# Altium schematic sheet Ethernet_PHY_2.SchDoc
size A4; SheetNumber: 6; SheetTotal: 16
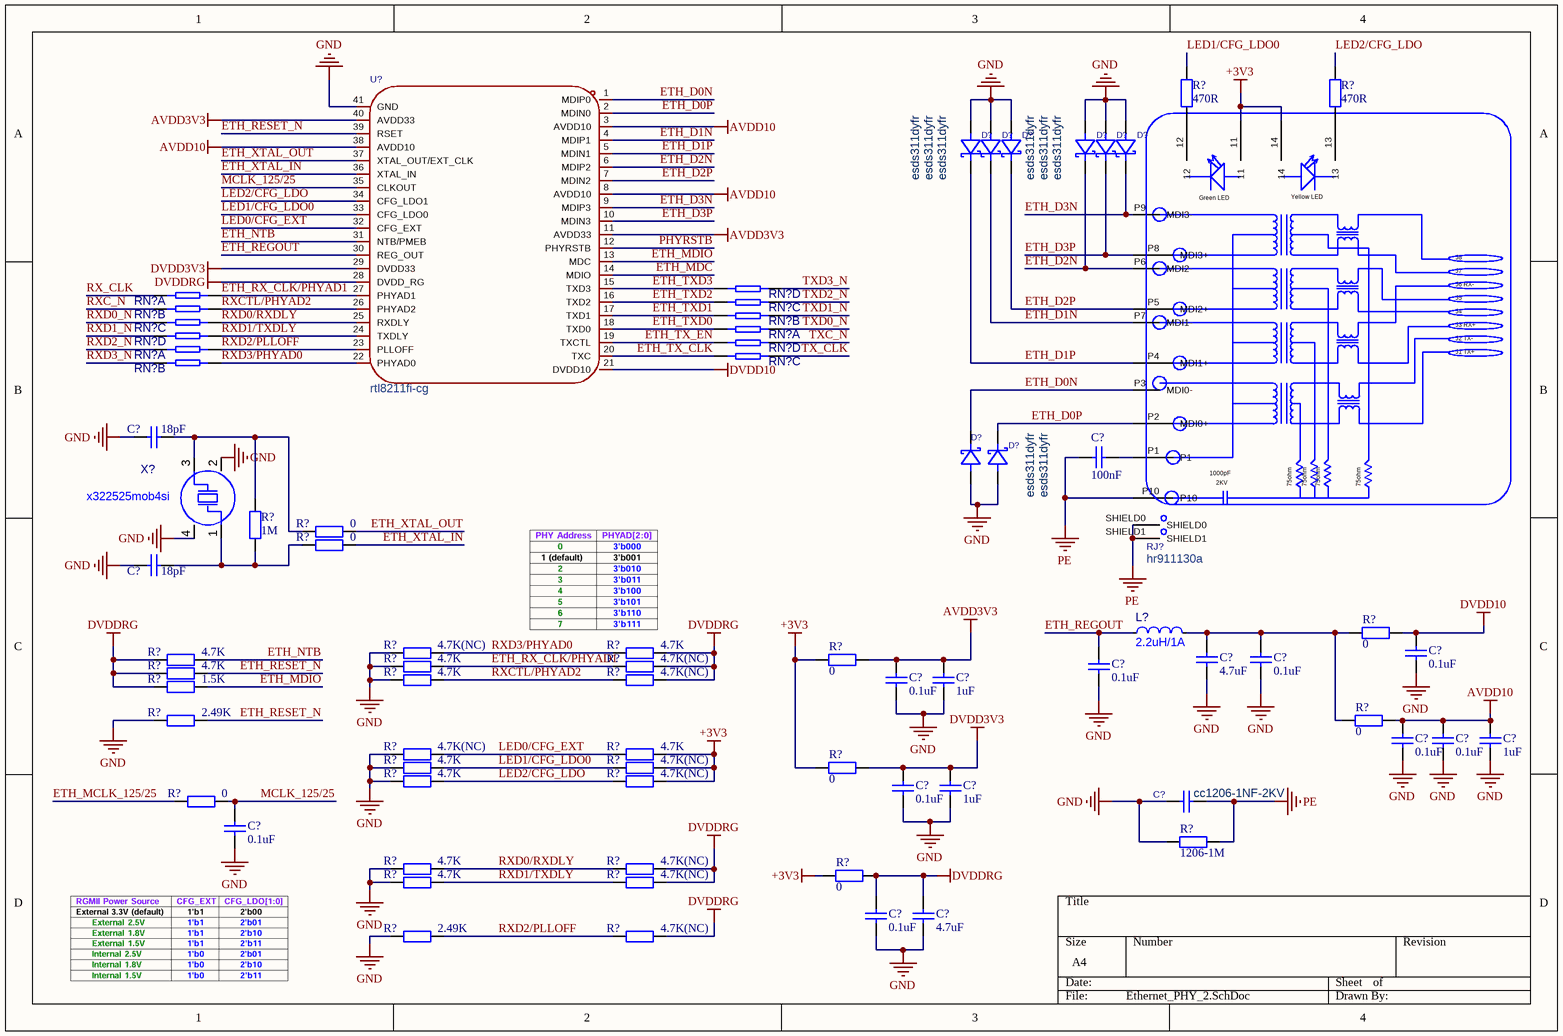
[diagram p0: Ethernet_PHY_2.SchDoc]

## Parts
(Parts that share a designator on the sheet are numbered #1, #2 ... from top to bottom, then left to right.)
C?#1  18pF  [C0603]
C?#2  100nF  [C0603]
C?#3  18pF  [C0603]
C?#4  0.1uF  [C0603]
C?#5  4.7uF  [C0603]
C?#6  0.1uF  [C0603]
C?#7  0.1uF  [C0603]
C?#8  0.1uF  [C0603]
C?#9  1uF  [C0603]
C?#10  0.1uF  [C0603]
C?#11  0.1uF  [C0603]
C?#12  1uF  [C0603]
C?#13  0.1uF  [C0603]
C?#14  1uF  [C0603]
C?#15  cc1206-1NF-2KV  [C1206]
C?#16  0.1uF  [C0603]
C?#17  0.1uF  [C0603]
C?#18  4.7uF  [C0603]
D?#1  esds311dyfr  [SOD-323_L1.7-W1.3-LS2.6-RD-1]
D?#2  esds311dyfr  [SOD-323_L1.7-W1.3-LS2.6-RD-1]
D?#3  esds311dyfr  [SOD-323_L1.7-W1.3-LS2.6-RD-1]
D?#4  esds311dyfr  [SOD-323_L1.7-W1.3-LS2.6-RD-1]
D?#5  esds311dyfr  [SOD-323_L1.7-W1.3-LS2.6-RD-1]
D?#6  esds311dyfr  [SOD-323_L1.7-W1.3-LS2.6-RD-1]
D?#7  esds311dyfr  [SOD-323_L1.7-W1.3-LS2.6-RD-1]
D?#8  esds311dyfr  [SOD-323_L1.7-W1.3-LS2.6-RD-1]
L?  2.2uH/1A  [L0603]
R?#1  470R  [R0603]
R?#2  470R  [R0603]
R?#3  0  [R0603]
R?#4  0  [R0603]
R?#5  1M  [R0603]
R?#6  4.7K(NC)  [R0603]
R?#7  4.7K  [R0603]
R?#8  4.7K  [R0603]
R?#9  0  [R0603]
R?#10  4.7K  [R0603]
R?#11  4.7K(NC)  [R0603]
R?#12  4.7K  [R0603]
R?#13  4.7K  [R0603]
R?#14  4.7K(NC)  [R0603]
R?#15  1.5K  [R0603]
R?#16  0  [R0603]
R?#17  2.49K  [R0603]
R?#18  0  [R0603]
R?#19  4.7K(NC)  [R0603]
R?#20  4.7K  [R0603]
R?#21  4.7K  [R0603]
R?#22  4.7K(NC)  [R0603]
R?#23  4.7K  [R0603]
R?#24  4.7K(NC)  [R0603]
R?#25  0  [R0603]
R?#26  0  [R0603]
R?#27  1206-1M  [F1206]
R?#28  4.7K  [R0603]
R?#29  4.7K(NC)  [R0603]
R?#30  4.7K  [R0603]
R?#31  4.7K(NC)  [R0603]
R?#32  0  [R0603]
R?#33  2.49K  [R0603]
R?#34  4.7K(NC)  [R0603]
RJ?  hr911130a  [RJ45-TH_HR911130A]
RN?#1  4d03wgj0330t5e  [RES-ARRAY-SMD_0603-8P-L3.2-W1.6-BL]  (value not drawn)  (part A of 4)
RN?#2  4d03wgj0330t5e  [RES-ARRAY-SMD_0603-8P-L3.2-W1.6-BL]  (value not drawn)  (part D of 4)
RN?#3  4d03wgj0330t5e  [RES-ARRAY-SMD_0603-8P-L3.2-W1.6-BL]  (value not drawn)  (part C of 4)
RN?#4  4d03wgj0330t5e  [RES-ARRAY-SMD_0603-8P-L3.2-W1.6-BL]  (value not drawn)  (part B of 4)
RN?#5  4d03wgj0330t5e  [RES-ARRAY-SMD_0603-8P-L3.2-W1.6-BL]  (value not drawn)  (part B of 4)
RN?#6  4d03wgj0330t5e  [RES-ARRAY-SMD_0603-8P-L3.2-W1.6-BL]  (value not drawn)  (part C of 4)
RN?#7  4d03wgj0330t5e  [RES-ARRAY-SMD_0603-8P-L3.2-W1.6-BL]  (value not drawn)  (part A of 4)
RN?#8  4d03wgj0330t5e  [RES-ARRAY-SMD_0603-8P-L3.2-W1.6-BL]  (value not drawn)  (part D of 4)
RN?#9  4d03wgj0330t5e  [RES-ARRAY-SMD_0603-8P-L3.2-W1.6-BL]  (value not drawn)  (part A of 4)
RN?#10  4d03wgj0330t5e  [RES-ARRAY-SMD_0603-8P-L3.2-W1.6-BL]  (value not drawn)  (part D of 4)
RN?#11  4d03wgj0330t5e  [RES-ARRAY-SMD_0603-8P-L3.2-W1.6-BL]  (value not drawn)  (part C of 4)
RN?#12  4d03wgj0330t5e  [RES-ARRAY-SMD_0603-8P-L3.2-W1.6-BL]  (value not drawn)  (part B of 4)
U?  rtl8211fi-cg  [QFN-40_L5.0-W5.0-P0.40-BL-EP3.7]
X?  x322525mob4si  [CRYSTAL-SMD_4P-L3.2-W2.5-BL]

## Nets
+3V3: R?#16.2 R?#20.2 R?#22.2 R?#24.2 R?#25.2 R?#32.2 RJ?.11 RJ?.14
AVDD3V3: C?#8.2 C?#9.2 R?#16.1 U?.11(AVDD33) U?.40(AVDD33)
AVDD10: C?#10.2 C?#11.2 C?#12.2 R?#18.1 U?.3(AVDD10) U?.8(AVDD10) U?.38(AVDD10)
DVDD3V3: C?#13.2 C?#14.2 R?#25.1 U?.29(DVDD33)
DVDD10: C?#4.2 R?#9.1 U?.21(DVDD10)
DVDDRG: C?#17.2 C?#18.2 R?#7.2 R?#8.1 R?#11.2 R?#12.1 R?#14.2 R?#15.1 R?#29.2 R?#31.2 R?#32.1 R?#34.2 U?.28(DVDD_RG)
GND: C?#1.1 C?#3.1 C?#4.1 C?#5.1 C?#6.1 C?#7.1 C?#8.1 C?#9.1 C?#10.1 C?#11.1 C?#12.1 C?#13.1 C?#14.1 C?#15.1 C?#16.1 C?#17.1 C?#18.1 D?#1.2(A) D?#2.2(A) D?#3.2(A) D?#4.2(A) D?#5.2(A) D?#6.2(A) D?#7.2(A) D?#8.2(A) R?#6.1 R?#10.1 R?#13.1 R?#17.1 R?#19.1 R?#21.1 R?#23.1 R?#27.1 R?#28.1 R?#30.1 R?#33.1 U?.41(GND) X?.2(GND) X?.4(GND)
PE: C?#2.1 C?#15.2 R?#27.2 RJ?.P10 RJ?.SHIELD0 RJ?.SHIELD1
ETH_D0N: D?#7.1(K) RJ?.P3(MDI0-) U?.1(MDIP0)
ETH_D0P: D?#8.1(K) RJ?.P2(MDI0+) U?.2(MDIN0)
ETH_D1N: D?#2.1(K) RJ?.P7(MDI1-) U?.4(MDIP1)
ETH_D1P: D?#1.1(K) RJ?.P4(MDI1+) U?.5(MDIN1)
ETH_D2N: D?#4.1(K) RJ?.P6(MDI2-) U?.6(MDIP2)
ETH_D2P: D?#3.1(K) RJ?.P5(MDI2+) U?.7(MDIN2)
ETH_D3N: D?#6.1(K) RJ?.P9(MDI3-) U?.9(MDIP3)
ETH_D3P: D?#5.1(K) RJ?.P8(MDI3+) U?.10(MDIN3)
ETH_MCLK_125/25: R?#26.1
ETH_MDC: U?.14(MDIO)
ETH_MDIO: R?#15.2 U?.13(MDC)
ETH_NTB: R?#8.2 U?.31(NTB/PMEB)
ETH_REGOUT: C?#7.2 L?.1 U?.30(REG_OUT)
ETH_RESET_N: R?#12.2 R?#17.2 U?.39(RSET)
ETH_RX_CLK/PHYAD1: R?#10.2 R?#11.1 RN?#1.8 U?.27(PHYAD1)
ETH_TX_CLK: RN?#11.3 U?.20(TXC)
ETH_TX_EN: RN?#10.4 U?.19(TXCTL)
ETH_TXD0: RN?#7.1 U?.18(TXD0)
ETH_TXD1: RN?#5.2 U?.17(TXD1)
ETH_TXD2: RN?#3.3 U?.16(TXD2)
ETH_TXD3: RN?#2.4 U?.15(TXD3)
ETH_XTAL_IN: R?#4.2 U?.36(XTAL_IN)
ETH_XTAL_OUT: R?#3.2 U?.37(XTAL_OUT/EXT_CLK)
LED0/CFG_EXT: R?#19.2 R?#20.1 U?.32(CFG_EXT)
LED1/CFG_LDO0: R?#1.2 R?#21.2 R?#22.1 U?.33(CFG_LDO0)
LED2/CFG_LDO: R?#2.2 R?#23.2 R?#24.1 U?.34(CFG_LDO1)
MCLK_125/25: C?#16.2 R?#26.2 U?.35(CLKOUT)
PHYRSTB: U?.12(PHYRSTB)
RX_CLK: RN?#1.1
RXC_N: RN?#4.2
RXCTL/PHYAD2: R?#13.2 R?#14.1 RN?#4.7 U?.26(PHYAD2)
RXD0/RXDLY: R?#28.2 R?#29.1 RN?#6.6 U?.25(RXDLY)
RXD0_N: RN?#6.3
RXD1/TXDLY: R?#30.2 R?#31.1 RN?#8.5 U?.24(TXDLY)
RXD1_N: RN?#8.4
RXD2/PLLOFF: R?#33.2 R?#34.1 RN?#9.8 U?.23(PLLOFF)
RXD2_N: RN?#9.1
RXD3/PHYAD0: R?#6.2 R?#7.1 RN?#12.7 U?.22(PHYAD0)
RXD3_N: RN?#12.2
TX_CLK: RN?#11.6
TXC_N: RN?#10.5
TXD0_N: RN?#7.8
TXD1_N: RN?#5.7
TXD2_N: RN?#3.6
TXD3_N: RN?#2.5
NetC?#1_2: C?#1.2 R?#3.1 R?#5.2 X?.3(OSC2)
NetC?#2_2: C?#2.2 RJ?.P1
NetC?#3_2: C?#3.2 R?#4.1 R?#5.1 X?.1(OSC1)
NetC?#5_2: C?#5.2 C?#6.2 L?.2 R?#9.2 R?#18.2
NetR?#1_1: R?#1.1 RJ?.12
NetR?#2_1: R?#2.1 RJ?.13

## Notes on the sheet
- (in symbol hr911130a) Green LED; Yellow LED; J8; J7; J6 RX-; J5; J4; J3 RX+; J2 TX-; J1 TX+; 1000pF; 75ohm; 2KV

## Library data of the parts
C?#1-C?#14 C?#16-C?#18 = C0603: Capacitor; Value: 104; Published: 8-Jun-2000; LatestRevisionDate: 17-Jul-2002; LatestRevisionNote: Re-released for DXP Platform.; Publisher: Altium Limited
C?#15 = cc1206kkx7rdbb102: 容值:1nF;精度:±10%;额定电压:2kV;温度系数:X7R;; Manufacturer: YAGEO(国巨); AddInBom: yes; ModelId: e4be705b945545a48e666415e3682bd8; ModelName: C1206_L3.2-W1.6-H1.3; ModelTransform: 125.984,62.992,0,0,0,0,0,0,0; Value: 1nF; Tolerance: ±10%; Voltage Rating: 2kV; Temperature Coefficient: X7R; Symbol: CC1206KKX7RDBB102; LCSC Part Name: 1nF ±10% 2kV; SupplierPart: C23631; ManufacturerPart: CC1206KKX7RDBB102; Supplier Footprint: 1206; JLCPCB Part Class: Extended Part; Datasheet: https://item.szlcsc.com/datasheet/CC1206KKX7RDBB102/24367.html; Supplier: LCSC; ConvertToPcb: yes; FootprintName: C1206
D?#1-D?#8 = esds311dyfr: 极性:单向;反向截止电压(Vrwm):3.6V;钳位电压:7.7V;峰值脉冲电流(Ipp):25A@8/20us;峰值脉冲功率(Ppp):170W@8/20us;击穿电压(VBR):7.5V;; Manufacturer: TI(德州仪器); AddInBom: yes; ModelId: eba151483b2844ffacda3a6d97308fa1; ModelTransform: 100.394,49.2125,0,0,0,0,0,0,0; Polarity: 单向; Reverse Stand-Off Voltage (Vrwm): 3.6V; Clamping Voltage: 7.7V; Voltage - Breakdown: 7.5V; Reverse Leakage Current (Ir): 5nA; Number of Channels: 单路; level of protection: IEC 61000-4-4；IEC 61000-4-5；IEC 61000-4-2; Type: TVS; Junction Capacitance: 4.5pF; LCSC Part Name: 单向TVS 3.6V截止 峰值浪涌电流：25A@8/20us; SupplierPart: C30938562; ManufacturerPart: ESDS311DYFR; Supplier Footprint: SOD-323; JLCPCB Part Class: Extended Part; Datasheet: https://www.ti.com.cn/cn/lit/ds/symlink/esds311.pdf?ts=1736913524660&ref_url=https%253A%252F%252Fwww.ti.com.cn%252Fsitesearch%252Fzh-cn%252Fdocs%252Funiversalsearch.tsp%253FlangPref%253Dzh-CN%2526nr%253D9%2526searchTerm%253DESDS311DYFR; Supplier: LCSC; ConvertToPcb: yes; SymbolName: ESDS311DYFR; FootprintName: SOD-323_L1.7-W1.3-LS2.6-RD-1; ModelName: SOD-323_L1.7-W1.3-LS2.6-RD-1; Peak Pulse Current (Ipp): 25A@8/20us; Peak Pulse Power Dissipation (Ppp): 170W@8/20us; Operating Temperature: -40℃~+125℃
L? = L0603: 电感值:10uH;精度:±10%;额定电流:3mA;饱和电流(Isat):-;直流电阻(DCR):1.85Ω;; Manufacturer: Sunlord(顺络); Symbol: SDFL1608S100KTF; AddInBom: yes; ModelId: 2bc5ec593d464d6ba9807aec0b5673c2; ModelName: L0603_L1.6-W0.8-H0.5_BEAD; ModelTransform: 62.992,31.496,0,180,0,0,0.094,0.629,0; Value: 10uH; Tolerance: ±10%; Current Rating: 3mA; DC Resistance(DCR): 1.85Ω; Q @ Frequency: 30@2MHz; Frequency - Self Resonant: 17MHz; LCSC Part Name: 10uH ±10%; SupplierPart: C1035; ManufacturerPart: SDFL1608S100KTF; Supplier Footprint: 0603; JLCPCB Part Class: Basic Part; Datasheet: https://item.szlcsc.com/datasheet/SDFL1608S100KTF/1387.html; Supplier: LCSC; ConvertToPcb: yes; FootprintName: L0603; Current - Saturation (Isat): -; Ratings: -
R?#1-R?#26 R?#28-R?#34 = R0603: Resistor; Published: 8-Jun-2000; LatestRevisionDate: 17-Jul-2002; LatestRevisionNote: Re-released for DXP Platform.; Publisher: Altium Limited
R?#27 = R1206: 特性：I Hold：0.05 ~ 3.0A。 快速响应故障电流。 尺寸1206 / 3.2×1.6mm。 低电阻。 低轮廓。 符合RoHS标准，无铅且无卤。应用：USB集线器、端口和外围设备。 计算机、手机、多媒体设备; Published: 8-Jun-2000; LatestRevisionDate: 17-Jul-2002; LatestRevisionNote: Re-released for DXP Platform.; Publisher: Altium Limited
RJ? = hr911130a: 连接器类型:RJ45插座;安装方式:弯插;端口数量:1;LED:带LED;屏蔽:有屏蔽;等级:-;触头材质:磷青铜;触头镀层:金;工作温度:0℃~+70℃;; Manufacturer: HANRUN(汉仁); AddInBom: yes; ModelId: 21112b2bcfef4316930bd636ff253b92; ModelTransform: 635.432,838.62,0,180,0,0,0,88.937,-157.48; Connector Type: RJ45插座; Number of Ports: 1; LED: 带LED; Shielding: 有屏蔽; PoE: 不带PoE; Supplementary Features: 带十字脚; Symbol: HR911130A; LCSC Part Name: 弯插 带LED; SupplierPart: C54408; ManufacturerPart: HR911130A; Supplier Footprint: 插件; JLCPCB Part Class: Extended Part; Datasheet: https://item.szlcsc.com/datasheet/HR911130A/55426.html; Supplier: LCSC; ConvertToPcb: yes; FootprintName: RJ45-TH_HR911130A; ModelName: RJ45-TH_HR911130A; Mounting Type: 弯插; Ratings: -; Contact Material: 磷青铜; Contact Plating: 金; Operating Temperature: 0℃~+70℃; Length: 21.2mm; Width: 16mm; Height: 13.3mm
RN?#1-RN?#12 = 4d03wgj0330t5e: 电阻器数:4;阻值:33Ω;精度:±5%;单个元件功率:62.5mW;温度系数:±200ppm/℃;; Manufacturer: UNI-ROYAL(厚声); AddInBom: yes; ModelId: edf39f9a2dca4b9a94267f442dd4f95a; ModelName: R0603-8P_L3.2-W1.6-H0.6; ModelTransform: 125.984,62.992,0,0,0,0,0,0,0; Number of Resistors: 4; Value: 33Ω; Tolerance: ±5%; Power(Watts): 62.5mW; Symbol: 4D03WGJ0330T5E; LCSC Part Name: 33Ω ±5%; SupplierPart: C25508; ManufacturerPart: 4D03WGJ0330T5E; Supplier Footprint: 0603x4; JLCPCB Part Class: Extended Part; Datasheet: https://atta.szlcsc.com/upload/public/pdf/source/20191224/C474318_2527498AE30E813171187CCD28401A71.pdf; Supplier: LCSC; ConvertToPcb: yes; FootprintName: RES-ARRAY-SMD_0603-8P-L3.2-W1.6-BL; Temperature Coefficient: ±200ppm/℃; Number of Pins: 8
U? = rtl8211fi-cg: 类型:以太网收发器;端口数量:-;MAC接口:RGMII;; Manufacturer: REALTEK(瑞昱); AddInBom: yes; ModelId: f658c93bb71c4057b80d8d21cfcdd805; ModelName: QFN-40_L5.0-W5.0-H0.9-P0.4-BL-EP; ModelTransform: 196.85,196.85,0,90,0,0,0,0,0; MAC Interface: RGMII; Ethernet Speed Standards: 1000BASE-T；10BASE-T；100BASE-TX; Data Rate: 10Mbit/s；100Mbit/s；1Gbit/s; Voltage - Supply: 1.8V；2.5V；3.3V；1.5V; Symbol: RTL8211FI-CG; LCSC Part Name: 集成10/100/1000M以太网精密收发器; SupplierPart: C717681; ManufacturerPart: RTL8211FI-CG; Supplier Footprint: QFN-40-EP(5x5); JLCPCB Part Class: Extended Part; Supplier: LCSC; ConvertToPcb: yes; FootprintName: QFN-40_L5.0-W5.0-P0.40-BL-EP3.7; Type: 以太网收发器; Number of ports: -
X? = x322525mob4si: 晶振类型:贴片晶振;频率:25MHz;常温频差:±10ppm;负载电容:12pF;频率稳定度:±20ppm;; Manufacturer: YXC(扬兴晶振); AddInBom: yes; ModelId: ff2dfd5650294453a14147960efe1838; ModelTransform: 125.984,98.425,0,0,0,0,0,0,0; Value: 25MHz; Normal temperature Frequency Tolerance: ±10ppm; Load Capacitance: 12pF; Frequency Stability: ±20ppm; Symbol: X322525MOB4SI; LCSC Part Name: YSX321SL 25MHZ 4P 3225 12PF ±10PPM -40~85℃ (±20PPM); SupplierPart: C9006; ManufacturerPart: X322525MOB4SI; Supplier Footprint: SMD3225-4P; JLCPCB Part Class: Basic Part; Datasheet: https://item.szlcsc.com/datasheet/X322525MOB4SI/9526.html; Supplier: LCSC; ConvertToPcb: yes; FootprintName: CRYSTAL-SMD_4P-L3.2-W2.5-BL; ModelName: CRYSTAL-SMD_4P-L3.2-W2.5-BL; Type: 贴片晶振; Operating Temperature: -40℃~+85℃